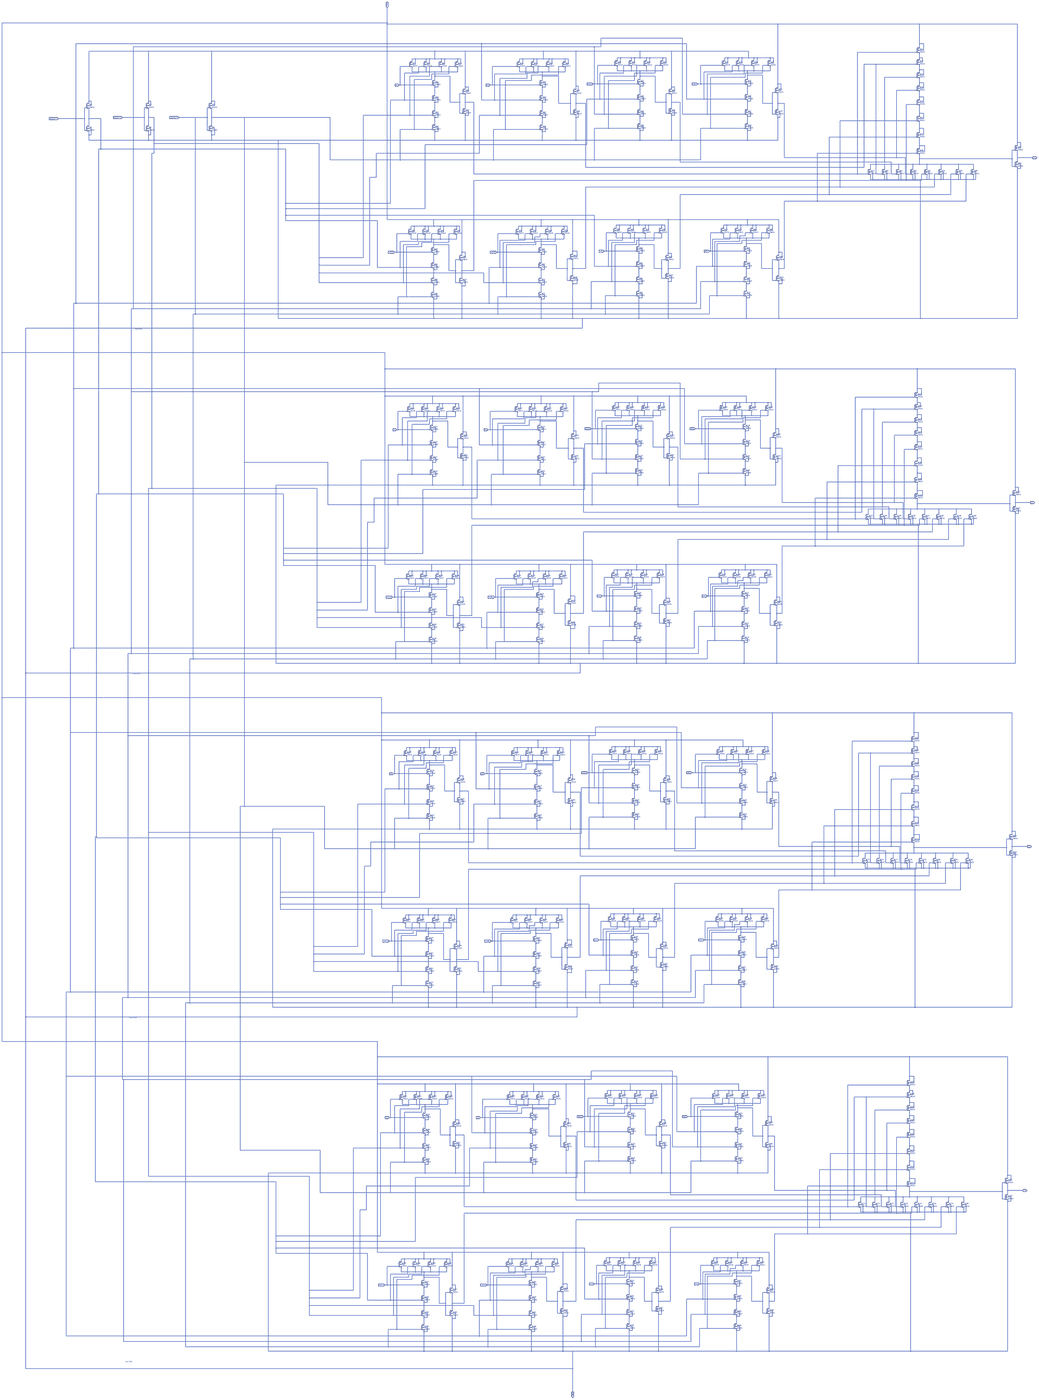
[diagram p0: schematic 4bit_8x1Multiplexer.asc, whole sheet]
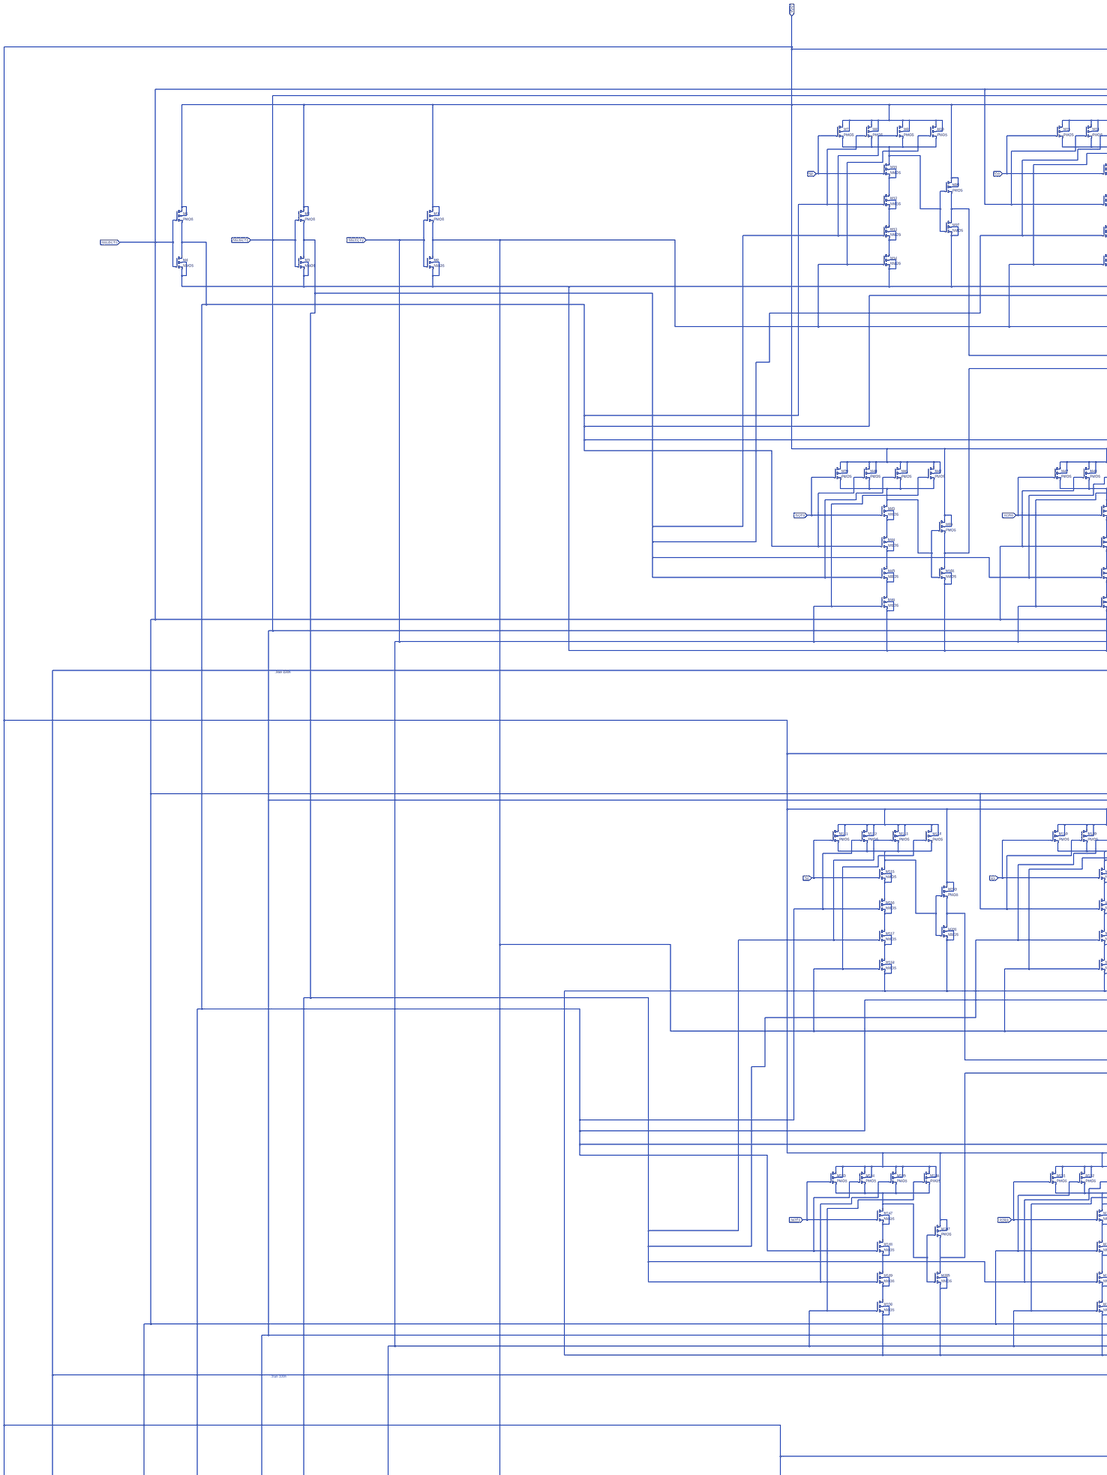
[diagram p1: schematic 4bit_8x1Multiplexer.asc, part, row 1 of 2, column 1 of 2]
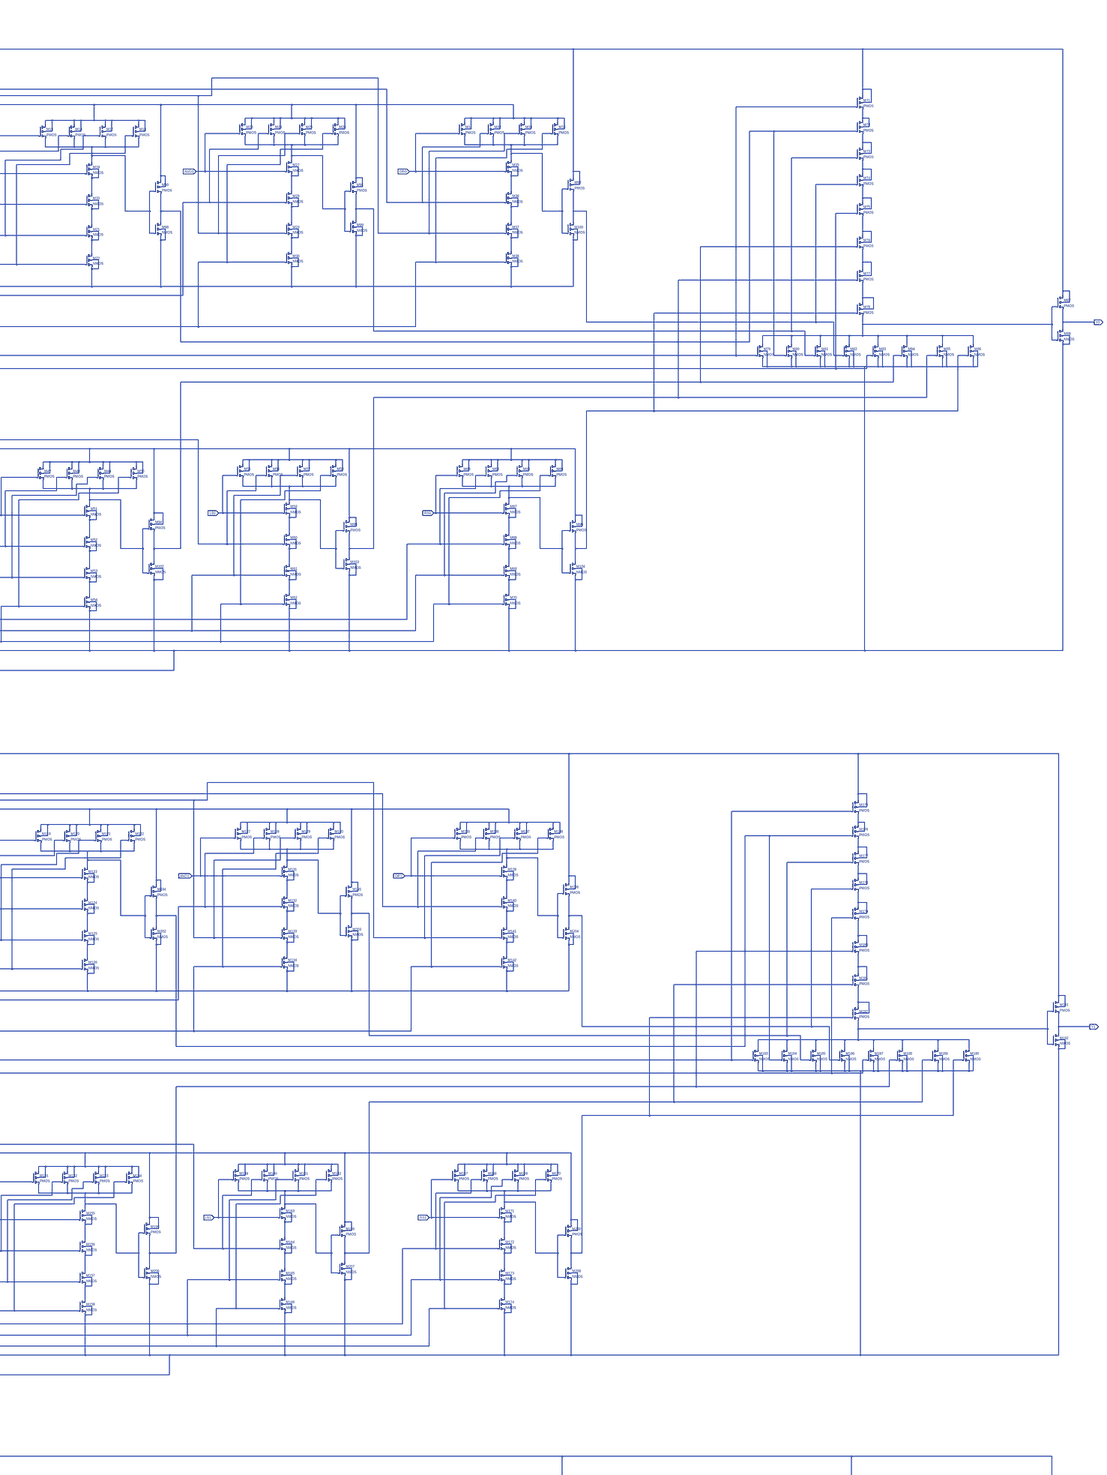
[diagram p2: schematic 4bit_8x1Multiplexer.asc, part, row 1 of 2, column 2 of 2]
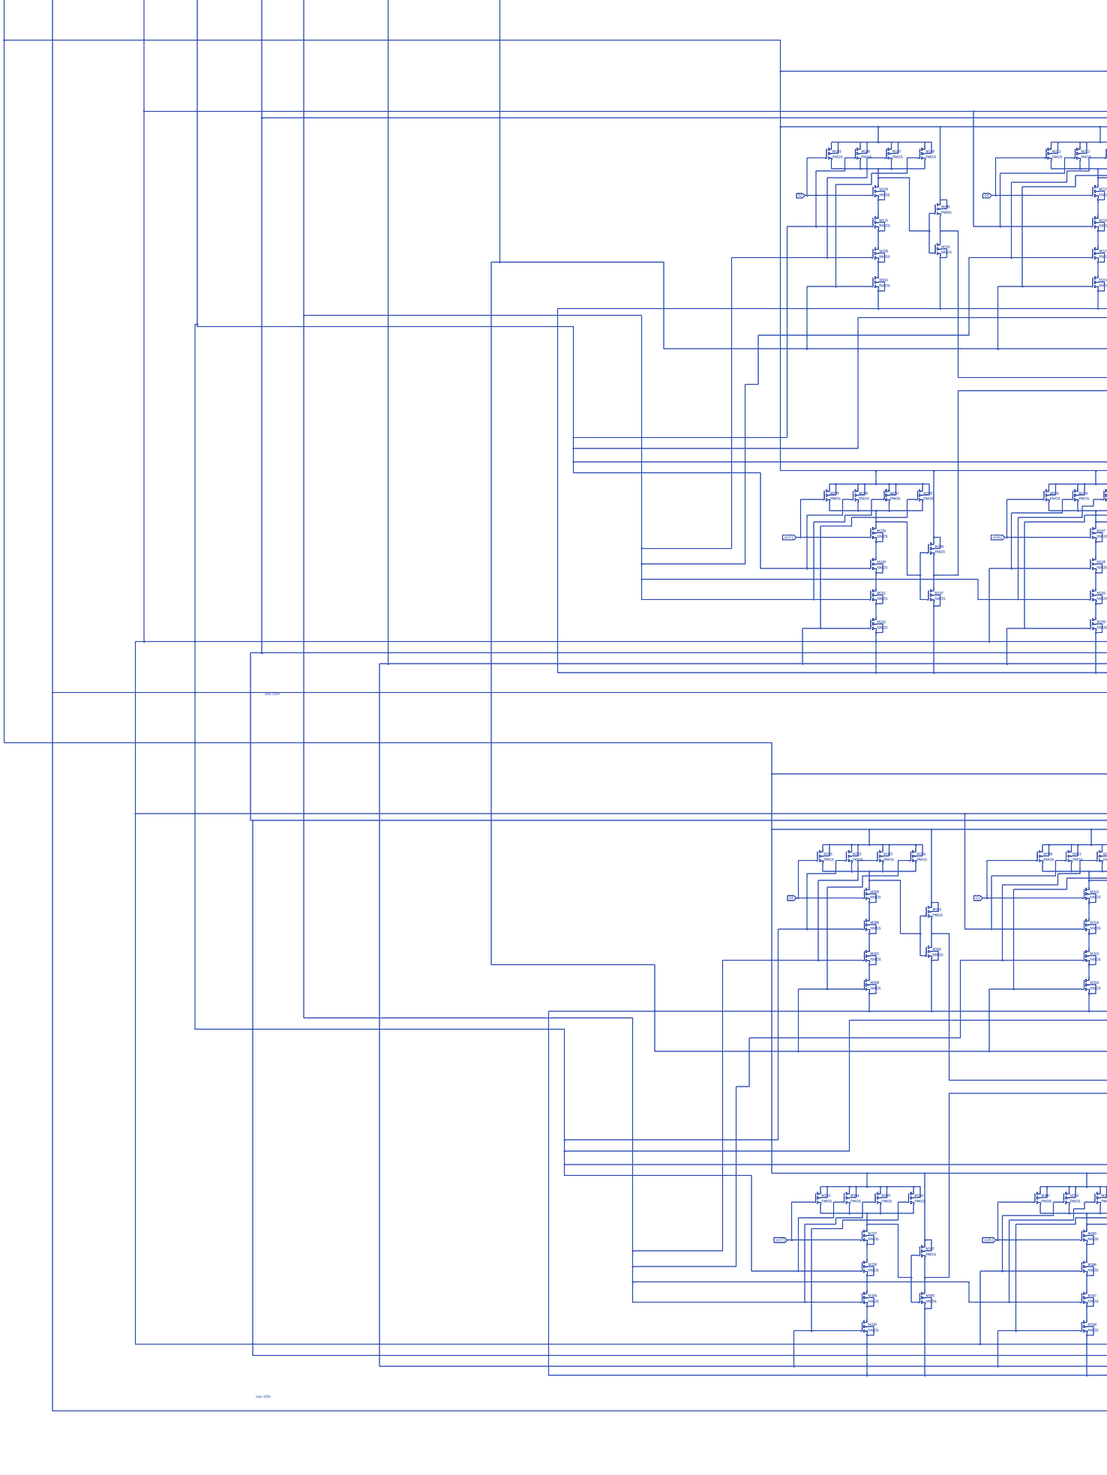
[diagram p3: schematic 4bit_8x1Multiplexer.asc, part, row 2 of 2, column 1 of 2]
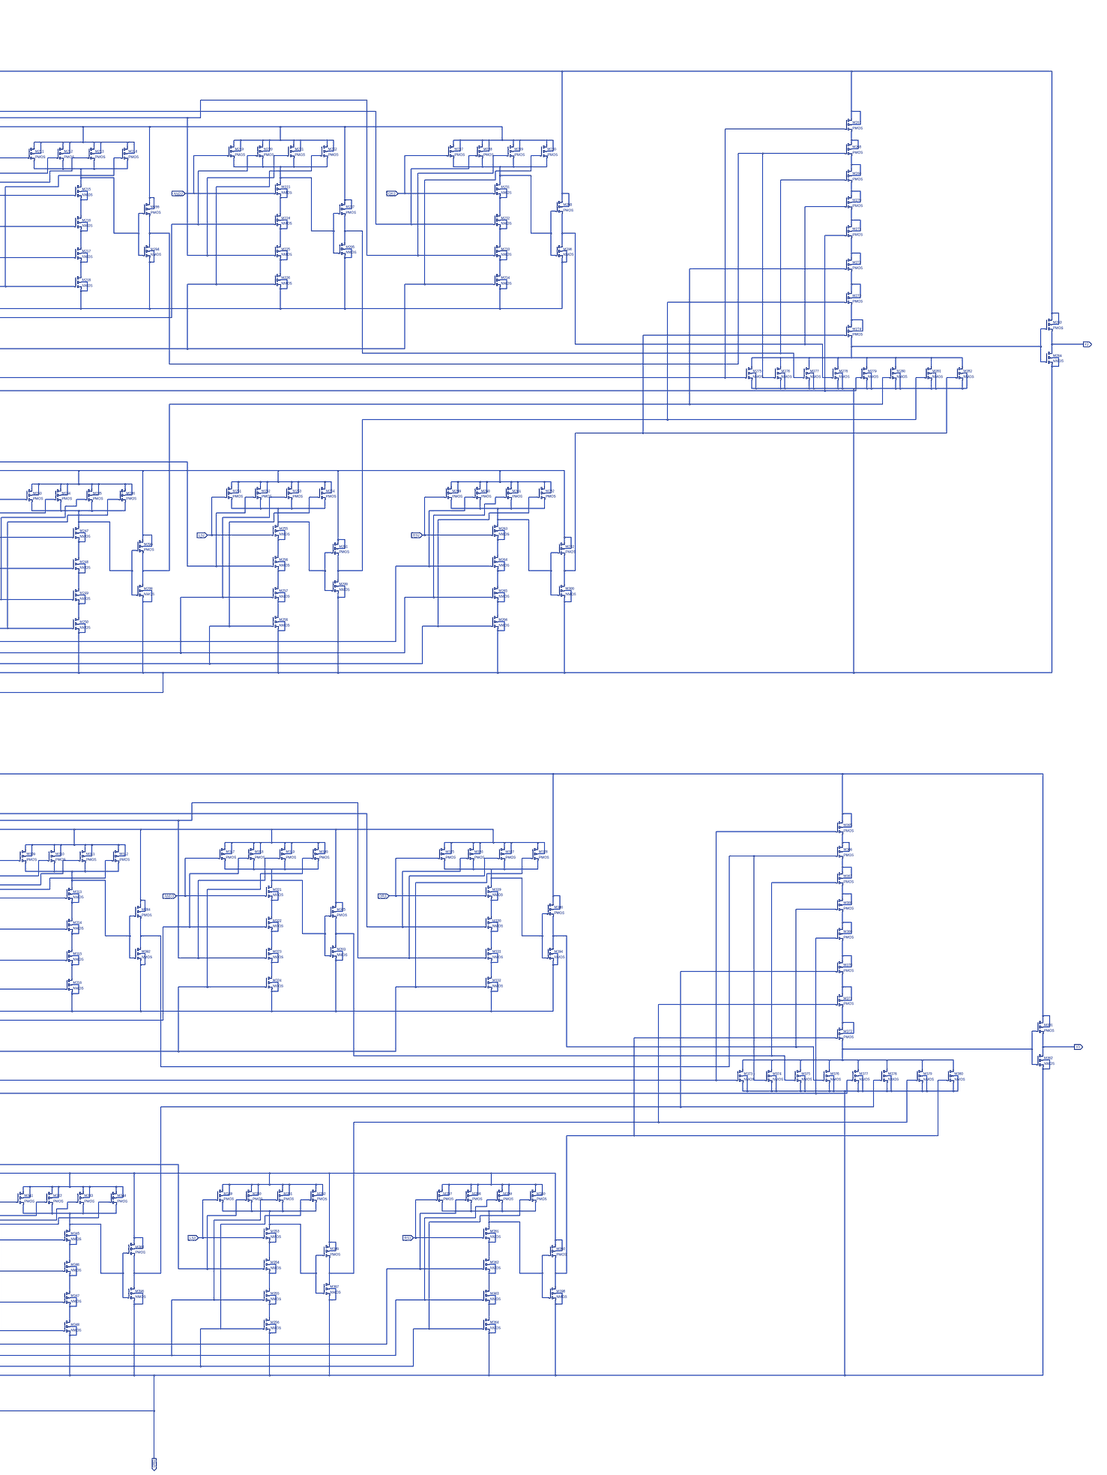
[diagram p4: schematic 4bit_8x1Multiplexer.asc, part, row 2 of 2, column 2 of 2]
* 4bit_8x1Multiplexer.asc
M1 VDD SELECT0 N004 VDD PMOS
M2 VDD SELECT1 N006 VDD PMOS
M3 VDD SELECT2 N005 VDD PMOS
M4 N004 SELECT0 GND GND NMOS
M5 N006 SELECT1 GND GND NMOS
M6 N005 SELECT2 GND GND NMOS
M7 VDD S0 N010 VDD PMOS
M8 VDD N004 N010 VDD PMOS
M9 VDD N006 N010 VDD PMOS
M10 VDD N005 N010 VDD PMOS
M11 N010 S0 N015 N015 NMOS
M12 N015 N004 N022 N022 NMOS
M13 N022 N006 N027 N027 NMOS
M14 N027 N005 GND GND NMOS
M15 VDD D0 N011 VDD PMOS
M16 VDD SELECT0 N011 VDD PMOS
M17 VDD N006 N011 VDD PMOS
M18 VDD N005 N011 VDD PMOS
M19 N011 D0 N016 N016 NMOS
M20 N016 SELECT0 N023 N023 NMOS
M21 N023 N006 N028 N028 NMOS
M22 N028 N005 GND GND NMOS
M23 VDD AND0 N008 VDD PMOS
M24 VDD N004 N008 VDD PMOS
M25 VDD SELECT1 N008 VDD PMOS
M26 VDD N005 N008 VDD PMOS
M27 N008 AND0 N013 N013 NMOS
M28 N013 N004 N019 N019 NMOS
M29 N019 SELECT1 N025 N025 NMOS
M30 N025 N005 GND GND NMOS
M31 VDD OR0 N009 VDD PMOS
M32 VDD SELECT0 N009 VDD PMOS
M33 VDD SELECT1 N009 VDD PMOS
M34 VDD N005 N009 VDD PMOS
M35 N009 OR0 N014 N014 NMOS
M36 N014 SELECT0 N020 N020 NMOS
M37 N020 SELECT1 N026 N026 NMOS
M38 N026 N005 GND GND NMOS
M39 VDD NOT0 N038 VDD PMOS
M40 VDD N004 N038 VDD PMOS
M41 VDD N006 N038 VDD PMOS
M42 VDD SELECT2 N038 VDD PMOS
M43 N038 NOT0 N042 N042 NMOS
M44 N042 N004 N046 N046 NMOS
M45 N046 N006 N050 N050 NMOS
M46 N050 SELECT2 GND GND NMOS
M47 VDD XOR0 N039 VDD PMOS
M48 VDD SELECT0 N039 VDD PMOS
M49 VDD N006 N039 VDD PMOS
M50 VDD SELECT2 N039 VDD PMOS
M51 N039 XOR0 N043 N043 NMOS
M52 N043 SELECT0 N047 N047 NMOS
M53 N047 N006 N051 N051 NMOS
M54 N051 SELECT2 GND GND NMOS
M55 VDD LS0 N036 VDD PMOS
M56 VDD N004 N036 VDD PMOS
M57 VDD SELECT1 N036 VDD PMOS
M58 VDD SELECT2 N036 VDD PMOS
M59 N036 LS0 N040 N040 NMOS
M60 N040 N004 N044 N044 NMOS
M61 N044 SELECT1 N048 N048 NMOS
M62 N048 SELECT2 GND GND NMOS
M63 VDD RS0 N037 VDD PMOS
M64 VDD SELECT0 N037 VDD PMOS
M65 VDD SELECT1 N037 VDD PMOS
M66 VDD SELECT2 N037 VDD PMOS
M67 N037 RS0 N041 N041 NMOS
M68 N041 SELECT0 N045 N045 NMOS
M69 N045 SELECT1 N049 N049 NMOS
M70 N049 SELECT2 GND GND NMOS
M71 VDD N001 N002 VDD PMOS
M72 N002 N003 N007 N002 PMOS
M73 N007 N012 N017 N007 PMOS
M74 N017 N018 N021 N017 PMOS
M75 N021 N024 N029 N021 PMOS
M76 N029 N030 N031 N029 PMOS
M77 N031 N032 N033 N031 PMOS
M78 N033 N035 N034 N033 PMOS
M79 N034 N001 GND GND NMOS
M80 N034 N003 GND GND NMOS
M81 N034 N012 GND GND NMOS
M82 N034 N018 GND GND NMOS
M83 N034 N024 GND GND NMOS
M84 N034 N030 GND GND NMOS
M85 N034 N032 GND GND NMOS
M86 N034 N035 GND GND NMOS
M87 VDD N034 Y0 VDD PMOS
M88 Y0 N034 GND GND NMOS
M89 VDD N010 N001 VDD PMOS
M90 VDD N011 N003 VDD PMOS
M91 VDD N008 N012 VDD PMOS
M92 VDD N009 N018 VDD PMOS
M93 VDD N038 N024 VDD PMOS
M94 VDD N039 N030 VDD PMOS
M95 VDD N036 N032 VDD PMOS
M96 VDD N037 N035 VDD PMOS
M97 N001 N010 GND GND NMOS
M98 N003 N011 GND GND NMOS
M99 N012 N008 GND GND NMOS
M100 N018 N009 GND GND NMOS
M101 N024 N038 GND GND NMOS
M102 N030 N039 GND GND NMOS
M103 N032 N036 GND GND NMOS
M104 N035 N037 GND GND NMOS
M111 VDD S1 N058 VDD PMOS
M112 VDD N004 N058 VDD PMOS
M113 VDD N006 N058 VDD PMOS
M114 VDD N005 N058 VDD PMOS
M115 N058 S1 N063 N063 NMOS
M116 N063 N004 N070 N070 NMOS
M117 N070 N006 N075 N075 NMOS
M118 N075 N005 GND GND NMOS
M119 VDD D1 N059 VDD PMOS
M120 VDD SELECT0 N059 VDD PMOS
M121 VDD N006 N059 VDD PMOS
M122 VDD N005 N059 VDD PMOS
M123 N059 D1 N064 N064 NMOS
M124 N064 SELECT0 N071 N071 NMOS
M125 N071 N006 N076 N076 NMOS
M126 N076 N005 GND GND NMOS
M127 VDD AND1 N056 VDD PMOS
M128 VDD N004 N056 VDD PMOS
M129 VDD SELECT1 N056 VDD PMOS
M130 VDD N005 N056 VDD PMOS
M131 N056 AND1 N061 N061 NMOS
M132 N061 N004 N067 N067 NMOS
M133 N067 SELECT1 N073 N073 NMOS
M134 N073 N005 GND GND NMOS
M135 VDD OR1 N057 VDD PMOS
M136 VDD SELECT0 N057 VDD PMOS
M137 VDD SELECT1 N057 VDD PMOS
M138 VDD N005 N057 VDD PMOS
M139 N057 OR1 N062 N062 NMOS
M140 N062 SELECT0 N068 N068 NMOS
M141 N068 SELECT1 N074 N074 NMOS
M142 N074 N005 GND GND NMOS
M143 VDD NOT1 N086 VDD PMOS
M144 VDD N004 N086 VDD PMOS
M145 VDD N006 N086 VDD PMOS
M146 VDD SELECT2 N086 VDD PMOS
M147 N086 NOT1 N090 N090 NMOS
M148 N090 N004 N094 N094 NMOS
M149 N094 N006 N098 N098 NMOS
M150 N098 SELECT2 GND GND NMOS
M151 VDD XOR1 N087 VDD PMOS
M152 VDD SELECT0 N087 VDD PMOS
M153 VDD N006 N087 VDD PMOS
M154 VDD SELECT2 N087 VDD PMOS
M155 N087 XOR1 N091 N091 NMOS
M156 N091 SELECT0 N095 N095 NMOS
M157 N095 N006 N099 N099 NMOS
M158 N099 SELECT2 GND GND NMOS
M159 VDD LS1 N084 VDD PMOS
M160 VDD N004 N084 VDD PMOS
M161 VDD SELECT1 N084 VDD PMOS
M162 VDD SELECT2 N084 VDD PMOS
M163 N084 LS1 N088 N088 NMOS
M164 N088 N004 N092 N092 NMOS
M165 N092 SELECT1 N096 N096 NMOS
M166 N096 SELECT2 GND GND NMOS
M167 VDD RS1 N085 VDD PMOS
M168 VDD SELECT0 N085 VDD PMOS
M169 VDD SELECT1 N085 VDD PMOS
M170 VDD SELECT2 N085 VDD PMOS
M171 N085 RS1 N089 N089 NMOS
M172 N089 SELECT0 N093 N093 NMOS
M173 N093 SELECT1 N097 N097 NMOS
M174 N097 SELECT2 GND GND NMOS
M175 VDD N052 N053 VDD PMOS
M176 N053 N054 N055 N053 PMOS
M177 N055 N060 N065 N055 PMOS
M178 N065 N066 N069 N065 PMOS
M179 N069 N072 N077 N069 PMOS
M180 N077 N078 N079 N077 PMOS
M181 N079 N080 N081 N079 PMOS
M182 N081 N083 N082 N081 PMOS
M183 N082 N052 GND GND NMOS
M184 N082 N054 GND GND NMOS
M185 N082 N060 GND GND NMOS
M186 N082 N066 GND GND NMOS
M187 N082 N072 GND GND NMOS
M188 N082 N078 GND GND NMOS
M189 N082 N080 GND GND NMOS
M190 N082 N083 GND GND NMOS
M191 VDD N082 Y1 VDD PMOS
M192 Y1 N082 GND GND NMOS
M193 VDD N058 N052 VDD PMOS
M194 VDD N059 N054 VDD PMOS
M195 VDD N056 N060 VDD PMOS
M196 VDD N057 N066 VDD PMOS
M197 VDD N086 N072 VDD PMOS
M198 VDD N087 N078 VDD PMOS
M199 VDD N084 N080 VDD PMOS
M200 VDD N085 N083 VDD PMOS
M201 N052 N058 GND GND NMOS
M202 N054 N059 GND GND NMOS
M203 N060 N056 GND GND NMOS
M204 N066 N057 GND GND NMOS
M205 N072 N086 GND GND NMOS
M206 N078 N087 GND GND NMOS
M207 N080 N084 GND GND NMOS
M208 N083 N085 GND GND NMOS
M105 VDD S2 N106 VDD PMOS
M106 VDD N004 N106 VDD PMOS
M107 VDD N006 N106 VDD PMOS
M108 VDD N005 N106 VDD PMOS
M109 N106 S2 N111 N111 NMOS
M110 N111 N004 N118 N118 NMOS
M209 N118 N006 N123 N123 NMOS
M210 N123 N005 GND GND NMOS
M211 VDD D2 N107 VDD PMOS
M212 VDD SELECT0 N107 VDD PMOS
M213 VDD N006 N107 VDD PMOS
M214 VDD N005 N107 VDD PMOS
M215 N107 D2 N112 N112 NMOS
M216 N112 SELECT0 N119 N119 NMOS
M217 N119 N006 N124 N124 NMOS
M218 N124 N005 GND GND NMOS
M219 VDD AND2 N104 VDD PMOS
M220 VDD N004 N104 VDD PMOS
M221 VDD SELECT1 N104 VDD PMOS
M222 VDD N005 N104 VDD PMOS
M223 N104 AND2 N109 N109 NMOS
M224 N109 N004 N115 N115 NMOS
M225 N115 SELECT1 N121 N121 NMOS
M226 N121 N005 GND GND NMOS
M227 VDD OR2 N105 VDD PMOS
M228 VDD SELECT0 N105 VDD PMOS
M229 VDD SELECT1 N105 VDD PMOS
M230 VDD N005 N105 VDD PMOS
M231 N105 OR2 N110 N110 NMOS
M232 N110 SELECT0 N116 N116 NMOS
M233 N116 SELECT1 N122 N122 NMOS
M234 N122 N005 GND GND NMOS
M235 VDD NOT2 N134 VDD PMOS
M236 VDD N004 N134 VDD PMOS
M237 VDD N006 N134 VDD PMOS
M238 VDD SELECT2 N134 VDD PMOS
M239 N134 NOT2 N138 N138 NMOS
M240 N138 N004 N142 N142 NMOS
M241 N142 N006 N146 N146 NMOS
M242 N146 SELECT2 GND GND NMOS
M243 VDD XOR2 N135 VDD PMOS
M244 VDD SELECT0 N135 VDD PMOS
M245 VDD N006 N135 VDD PMOS
M246 VDD SELECT2 N135 VDD PMOS
M247 N135 XOR2 N139 N139 NMOS
M248 N139 SELECT0 N143 N143 NMOS
M249 N143 N006 N147 N147 NMOS
M250 N147 SELECT2 GND GND NMOS
M251 VDD LS2 N132 VDD PMOS
M252 VDD N004 N132 VDD PMOS
M253 VDD SELECT1 N132 VDD PMOS
M254 VDD SELECT2 N132 VDD PMOS
M255 N132 LS2 N136 N136 NMOS
M256 N136 N004 N140 N140 NMOS
M257 N140 SELECT1 N144 N144 NMOS
M258 N144 SELECT2 GND GND NMOS
M259 VDD RS2 N133 VDD PMOS
M260 VDD SELECT0 N133 VDD PMOS
M261 VDD SELECT1 N133 VDD PMOS
M262 VDD SELECT2 N133 VDD PMOS
M263 N133 RS2 N137 N137 NMOS
M264 N137 SELECT0 N141 N141 NMOS
M265 N141 SELECT1 N145 N145 NMOS
M266 N145 SELECT2 GND GND NMOS
M267 VDD N100 N101 VDD PMOS
M268 N101 N102 N103 N101 PMOS
M269 N103 N108 N113 N103 PMOS
M270 N113 N114 N117 N113 PMOS
M271 N117 N120 N125 N117 PMOS
M272 N125 N126 N127 N125 PMOS
M273 N127 N128 N129 N127 PMOS
M274 N129 N131 N130 N129 PMOS
M275 N130 N100 GND GND NMOS
M276 N130 N102 GND GND NMOS
M277 N130 N108 GND GND NMOS
M278 N130 N114 GND GND NMOS
M279 N130 N120 GND GND NMOS
M280 N130 N126 GND GND NMOS
M281 N130 N128 GND GND NMOS
M282 N130 N131 GND GND NMOS
M283 VDD N130 Y2 VDD PMOS
M284 Y2 N130 GND GND NMOS
M285 VDD N106 N100 VDD PMOS
M286 VDD N107 N102 VDD PMOS
M287 VDD N104 N108 VDD PMOS
M288 VDD N105 N114 VDD PMOS
M289 VDD N134 N120 VDD PMOS
M290 VDD N135 N126 VDD PMOS
M291 VDD N132 N128 VDD PMOS
M292 VDD N133 N131 VDD PMOS
M293 N100 N106 GND GND NMOS
M294 N102 N107 GND GND NMOS
M295 N108 N104 GND GND NMOS
M296 N114 N105 GND GND NMOS
M297 N120 N134 GND GND NMOS
M298 N126 N135 GND GND NMOS
M299 N128 N132 GND GND NMOS
M300 N131 N133 GND GND NMOS
M301 VDD S3 N154 VDD PMOS
M302 VDD N004 N154 VDD PMOS
M303 VDD N006 N154 VDD PMOS
M304 VDD N005 N154 VDD PMOS
M305 N154 S3 N159 N159 NMOS
M306 N159 N004 N166 N166 NMOS
M307 N166 N006 N171 N171 NMOS
M308 N171 N005 GND GND NMOS
M309 VDD D3 N155 VDD PMOS
M310 VDD SELECT0 N155 VDD PMOS
M311 VDD N006 N155 VDD PMOS
M312 VDD N005 N155 VDD PMOS
M313 N155 D3 N160 N160 NMOS
M314 N160 SELECT0 N167 N167 NMOS
M315 N167 N006 N172 N172 NMOS
M316 N172 N005 GND GND NMOS
M317 VDD AND3 N152 VDD PMOS
M318 VDD N004 N152 VDD PMOS
M319 VDD SELECT1 N152 VDD PMOS
M320 VDD N005 N152 VDD PMOS
M321 N152 AND3 N157 N157 NMOS
M322 N157 N004 N163 N163 NMOS
M323 N163 SELECT1 N169 N169 NMOS
M324 N169 N005 GND GND NMOS
M325 VDD OR3 N153 VDD PMOS
M326 VDD SELECT0 N153 VDD PMOS
M327 VDD SELECT1 N153 VDD PMOS
M328 VDD N005 N153 VDD PMOS
M329 N153 OR3 N158 N158 NMOS
M330 N158 SELECT0 N164 N164 NMOS
M331 N164 SELECT1 N170 N170 NMOS
M332 N170 N005 GND GND NMOS
M333 VDD NOT3 N182 VDD PMOS
M334 VDD N004 N182 VDD PMOS
M335 VDD N006 N182 VDD PMOS
M336 VDD SELECT2 N182 VDD PMOS
M337 N182 NOT3 N186 N186 NMOS
M338 N186 N004 N190 N190 NMOS
M339 N190 N006 N194 N194 NMOS
M340 N194 SELECT2 GND GND NMOS
M341 VDD XOR3 N183 VDD PMOS
M342 VDD SELECT0 N183 VDD PMOS
M343 VDD N006 N183 VDD PMOS
M344 VDD SELECT2 N183 VDD PMOS
M345 N183 XOR3 N187 N187 NMOS
M346 N187 SELECT0 N191 N191 NMOS
M347 N191 N006 N195 N195 NMOS
M348 N195 SELECT2 GND GND NMOS
M349 VDD LS3 N180 VDD PMOS
M350 VDD N004 N180 VDD PMOS
M351 VDD SELECT1 N180 VDD PMOS
M352 VDD SELECT2 N180 VDD PMOS
M353 N180 LS3 N184 N184 NMOS
M354 N184 N004 N188 N188 NMOS
M355 N188 SELECT1 N192 N192 NMOS
M356 N192 SELECT2 GND GND NMOS
M357 VDD RS3 N181 VDD PMOS
M358 VDD SELECT0 N181 VDD PMOS
M359 VDD SELECT1 N181 VDD PMOS
M360 VDD SELECT2 N181 VDD PMOS
M361 N181 RS3 N185 N185 NMOS
M362 N185 SELECT0 N189 N189 NMOS
M363 N189 SELECT1 N193 N193 NMOS
M364 N193 SELECT2 GND GND NMOS
M365 VDD N148 N149 VDD PMOS
M366 N149 N150 N151 N149 PMOS
M367 N151 N156 N161 N151 PMOS
M368 N161 N162 N165 N161 PMOS
M369 N165 N168 N173 N165 PMOS
M370 N173 N174 N175 N173 PMOS
M371 N175 N176 N177 N175 PMOS
M372 N177 N179 N178 N177 PMOS
M373 N178 N148 GND GND NMOS
M374 N178 N150 GND GND NMOS
M375 N178 N156 GND GND NMOS
M376 N178 N162 GND GND NMOS
M377 N178 N168 GND GND NMOS
M378 N178 N174 GND GND NMOS
M379 N178 N176 GND GND NMOS
M380 N178 N179 GND GND NMOS
M381 VDD N178 Y3 VDD PMOS
M382 Y3 N178 GND GND NMOS
M383 VDD N154 N148 VDD PMOS
M384 VDD N155 N150 VDD PMOS
M385 VDD N152 N156 VDD PMOS
M386 VDD N153 N162 VDD PMOS
M387 VDD N182 N168 VDD PMOS
M388 VDD N183 N174 VDD PMOS
M389 VDD N180 N176 VDD PMOS
M390 VDD N181 N179 VDD PMOS
M391 N148 N154 GND GND NMOS
M392 N150 N155 GND GND NMOS
M393 N156 N152 GND GND NMOS
M394 N162 N153 GND GND NMOS
M395 N168 N182 GND GND NMOS
M396 N174 N183 GND GND NMOS
M397 N176 N180 GND GND NMOS
M398 N179 N181 GND GND NMOS
.model NMOS NMOS
.model PMOS PMOS
.lib standard.mos
.tran 100n
* .tran 100n
* .tran 100n
* .tran 100n
.backanno
.end